# EasyEDA Pro project P3+KG.epro, board PCB1
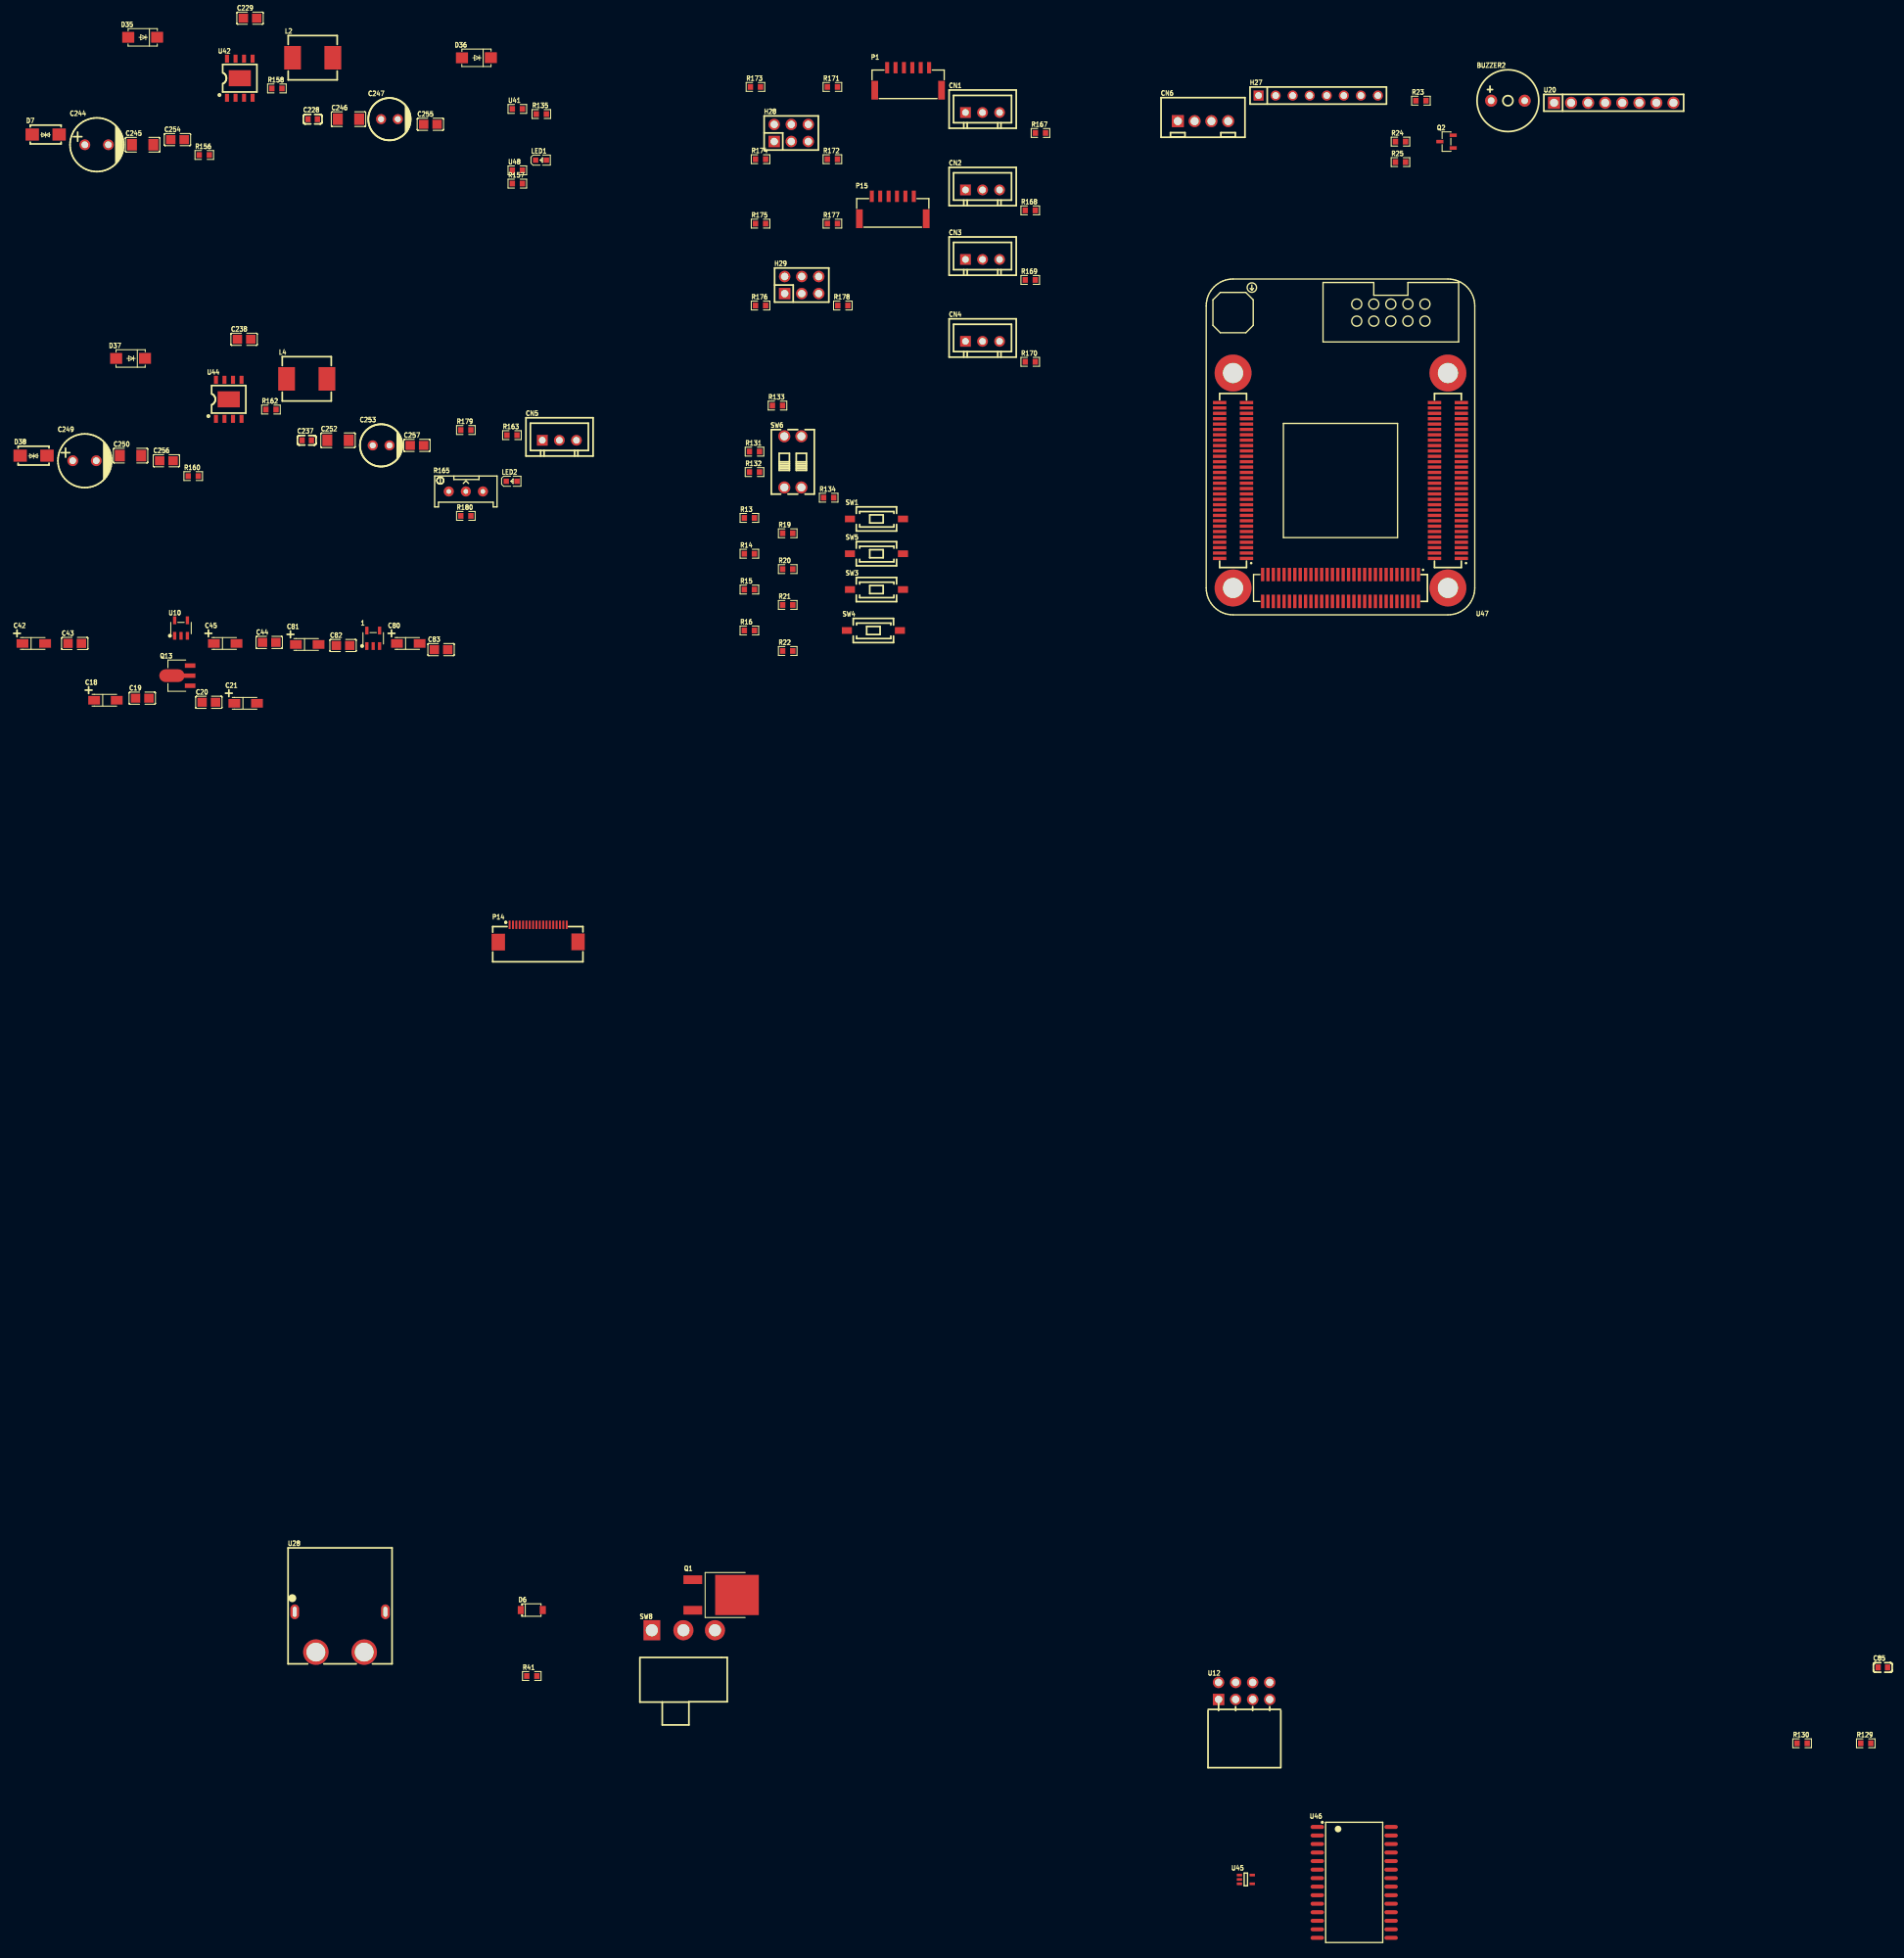
[diagram p11: board, top side]
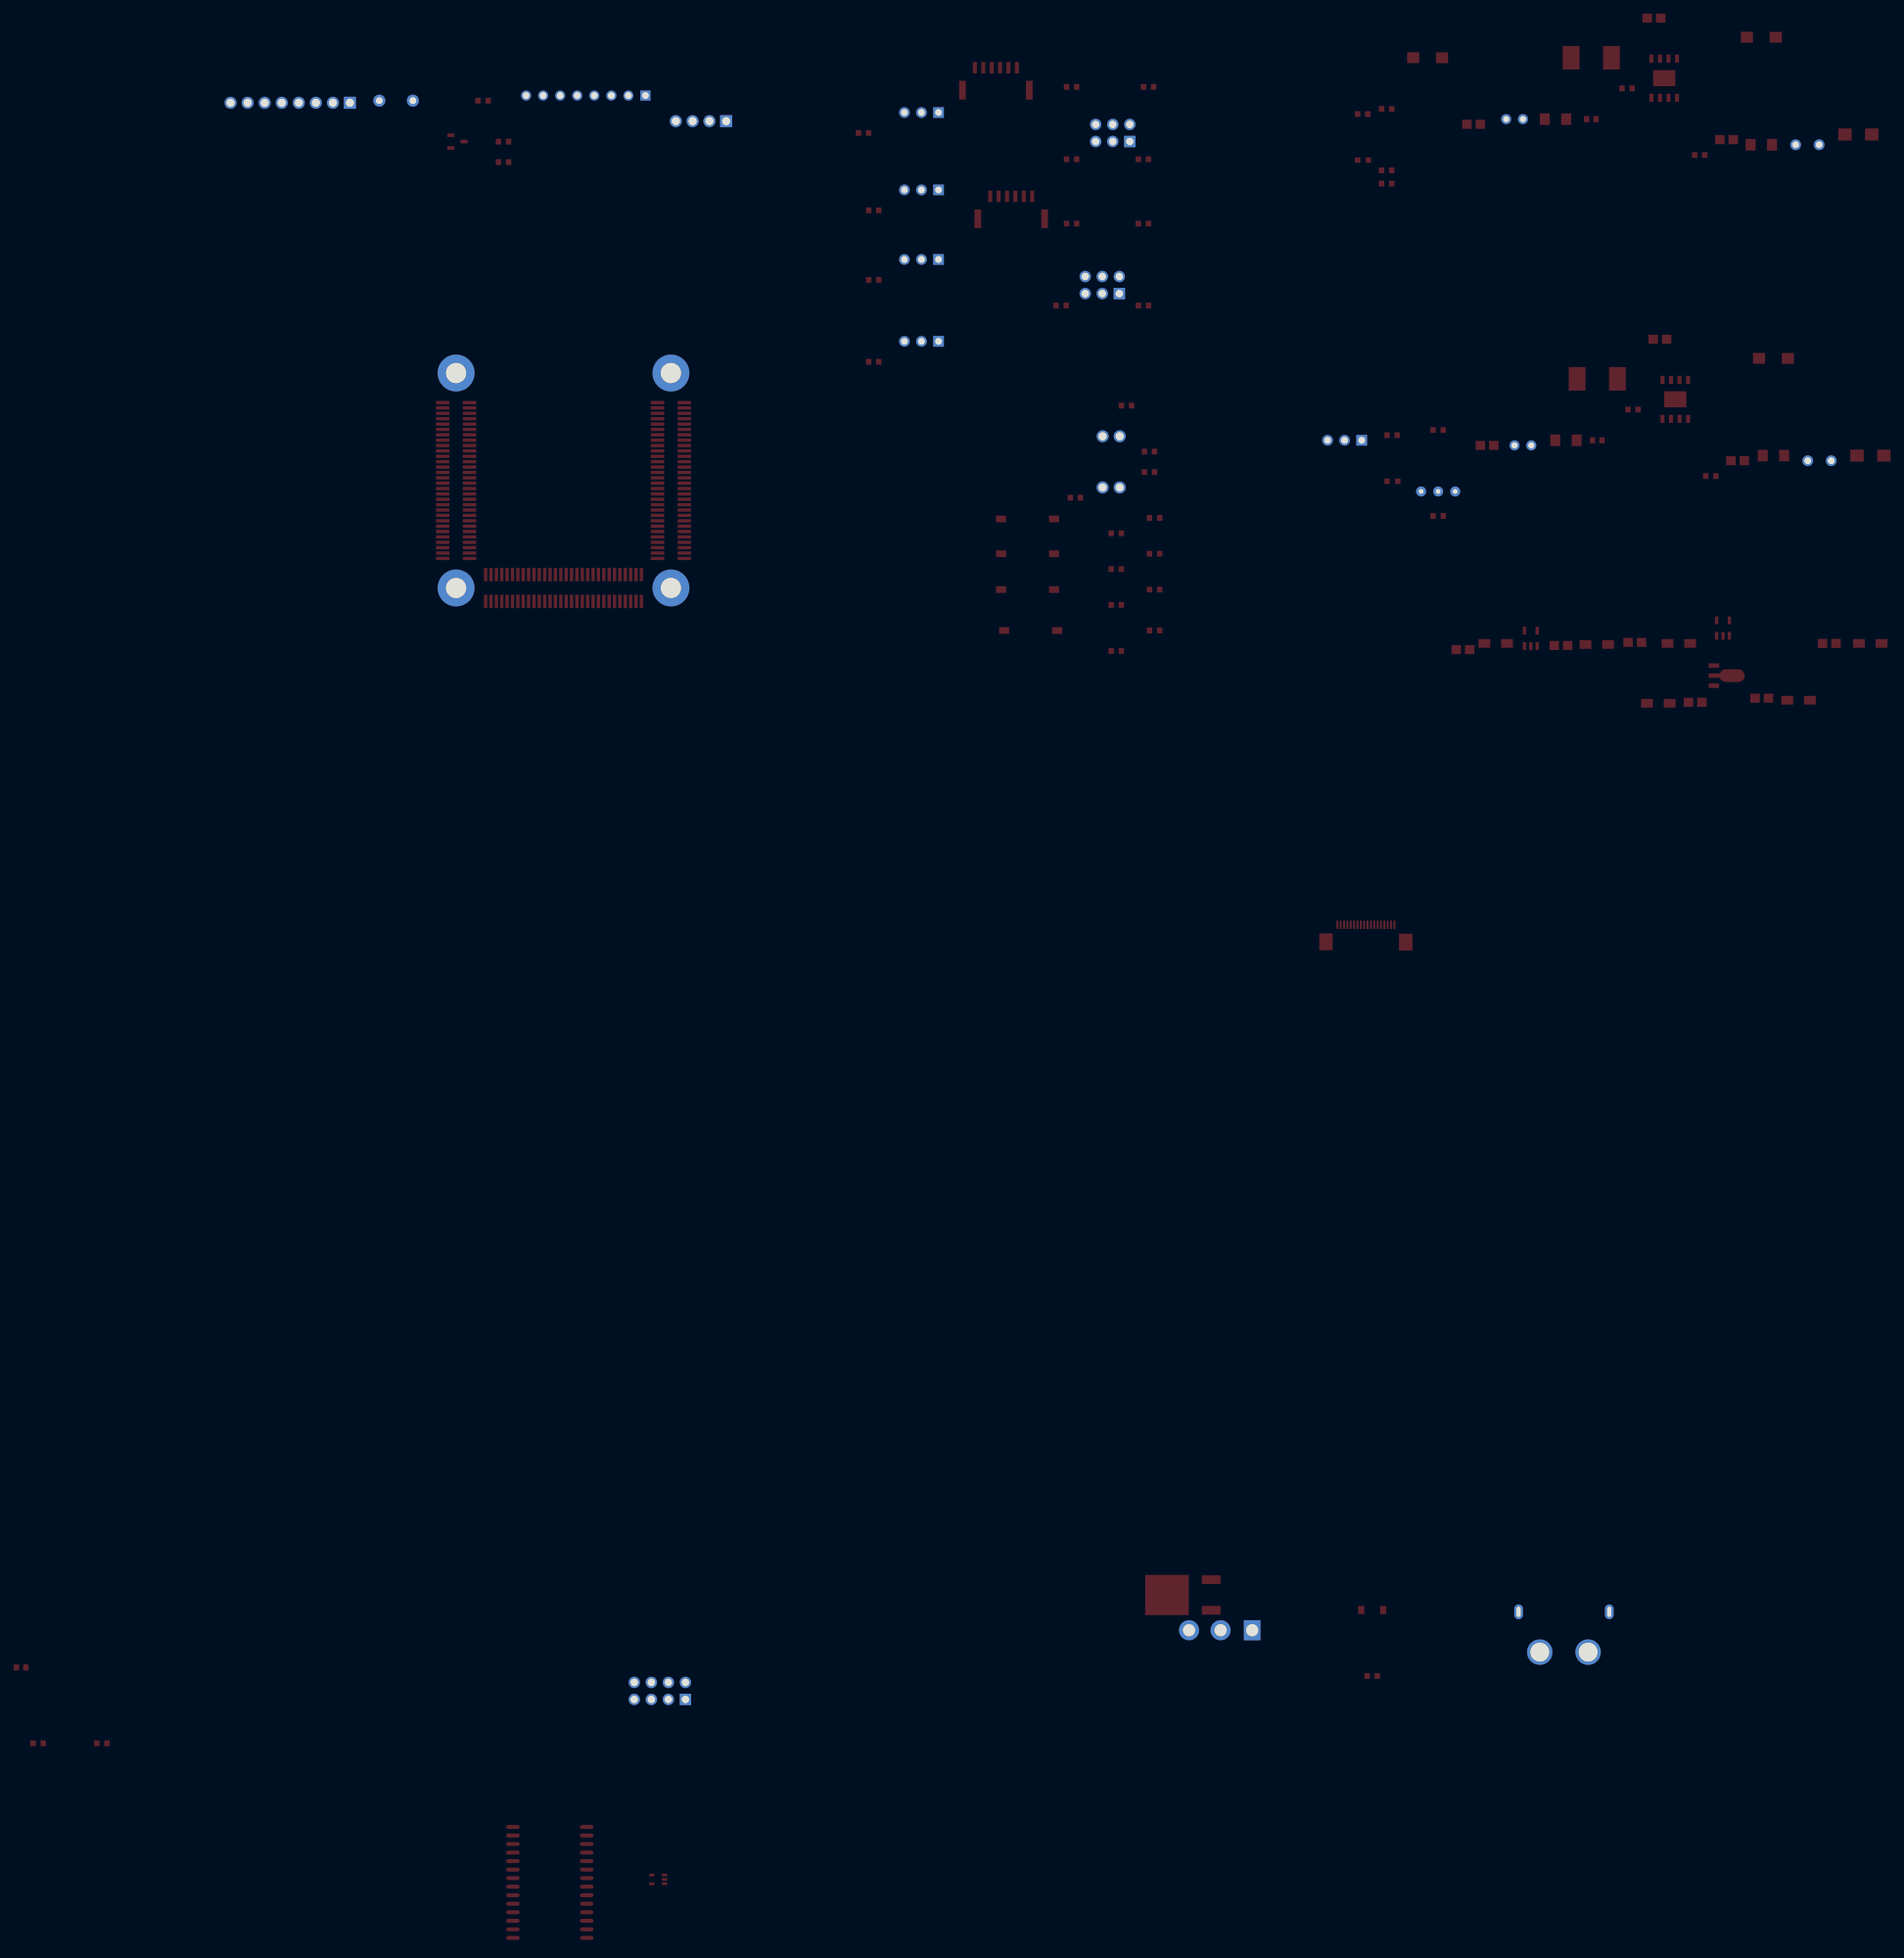
[diagram p12: board, bottom side, seen from below]

No outline. copper layers: Top Layer, Bottom Layer. Coordinates in mm from the lowest, leftmost part position.
Stack: Top Layer 0.035mm / Dielectric1 1.51mm FR4 er 4.5 / Bottom Layer 0.035mm

## Design rules (mm)
template: JLCPCB Capability(Two Layers Board)
spacing copperThickness1oz (default): track to track 0.102, other pairs 0.152 to 0.3
spacing copperThickness2oz: track to track 0.203, other pairs 0.152 to 0.3
track width copperThickness1oz (default): min 0.127, default 0.254, max 2.54
track width copperThickness2oz: min 0.203, default 0.254, max 2.54
differential pair differentialPair (default): width min 0.127, default 0.254, max 2.54; gap min 0.152, default 0.152
via viaSize (default): diameter min 0.5, default 0.61, max 10; hole min 0.3, default 0.305, max 6.3

## Placement (name value [footprint] x y rotation side)
1  RT9013-33GB  [SOT-23-5_L3.0-W1.7-P0.95-LS2.8-BL]  50.59 185.23 0 top
BUZZER2  3kHz  [BUZ-TH_BD9.0-P5.00-D0.6-FD]  219.6 265.28 0 top
C18  10uF  [CAP-SMD_L3.2-W1.6-RD-C7171]  10.7 176.01 0 top
C19  100nF  [C0805]  16.19 176.32 0 top
C20  100nF  [C0805]  26.1 175.71 0 top
C21  10uF  [CAP-SMD_L3.2-W1.6-RD-C7171]  31.59 175.55 0 top
C42  10uF  [CAP-SMD_L3.2-W1.6-RD-C7171]  0.03 184.47 0 top
C43  100nF  [C0805]  6.13 184.47 0 top
C44  100nF  [C0805]  35.09 184.62 0 top
C45  10uF  [CAP-SMD_L3.2-W1.6-RD-C7171]  28.54 184.47 0 top
C80  10uF  [CAP-SMD_L3.2-W1.6-RD-C7171]  55.82 184.47 0 top
C81  10uF  [CAP-SMD_L3.2-W1.6-RD-C7171]  40.76 184.31 0 top
C82  100nF  [C0805]  46.1 184.16 0 top
C83  100nF  [C0805]  60.69 183.55 0 top
C85  100nF  [C0603]  275.45 32 0 top
C228  4.7nF  [C0603]  41.58 262.52 0 top
C229  100nF  [C0805]  32.24 277.56 0 top
C237  4.7nF  [C0603]  40.69 214.71 0 top
C238  100nF  [C0805]  31.36 229.75 0 top
C244  100uF  [CAP-TH_BD8.0-P3.50-D0.5-FD]  9.39 258.71 0 top
C245  4.7uF  [C1206]  16.25 258.71 0 top
C246  47uF  [C1206]  46.91 262.52 0 top
C247  220uF  [CAP-TH_BD6.3-P2.50-D0.5-FD]  53.01 262.52 0 top
C249  100uF  [CAP-TH_BD8.0-P3.50-D0.5-FD]  7.59 211.67 0 top
C250  4.7uF  [C1206]  14.45 212.43 0 top
C252  47uF  [C1206]  45.35 214.71 0 top
C253  220uF  [CAP-TH_BD6.3-P2.50-D0.5-FD]  51.76 213.95 0 top
C254  100nF  [C0805]  21.43 259.48 0 top
C255  100nF  [C0805]  59.1 261.76 0 top
C256  100nF  [C0805]  19.78 211.67 0 top
C257  100nF  [C0805]  57.1 213.95 0 top
CN1  ZX-XH2.54-3PZZ  [CONN-TH_3P-P2.54_2501S-3P]  141.35 263.52 0 top
CN2  ZX-XH2.54-3PZZ  [CONN-TH_3P-P2.54_2501S-3P]  141.35 251.99 0 top
CN3  ZX-XH2.54-3PZZ  [CONN-TH_3P-P2.54_2501S-3P]  141.35 241.64 0 top
CN4  ZX-XH2.54-3PZZ  [CONN-TH_3P-P2.54_2501S-3P]  141.35 229.44 0 top
CN5  ZX-XH2.54-3PZZ  [CONN-TH_3P-P2.54_2501S-3P]  78.32 214.71 0 top
CN6  AXH-4A-11  [CONN-TH_KH-XH-4A-Z]  174.19 262.23 0 top
D6  BZT52C16  [SOD-123_L2.7-W1.6-LS3.7-RD]  74.21 40.55 0 top
D7  SMAJ18CA  [SMA_L4.4-W2.6-LS5.0-BI]  1.8 260.24 0 top
D35  SS54  [SMA_L4.3-W2.6-LS5.0-FD]  16.25 274.72 0 top
D36  SS54  [SMA_L4.3-W2.6-LS5.0-FD]  65.96 271.67 0 top
D37  SS54  [SMA_L4.3-W2.6-LS5.0-FD]  14.45 226.91 0 top
D38  SMAJ18CA  [SMA_L4.4-W2.6-LS5.0-BI]  0 212.43 0 top
H27  PZ254V-11-08P  [HDR-TH_8P-P2.54-V-M]  191.35 266.04 0 top
H28  PZ254V-12-6P  [HDR-TH_6P-P2.54-V-M-R2-C3-S2.54]  112.86 260.47 0 top
H29  PZ254V-12-6P  [HDR-TH_6P-P2.54-V-M-R2-C3-S2.54]  114.42 237.83 0 top
L2  4.7uH  [IND-SMD_L7.3-W6.6_YSPI07XX]  41.58 271.67 0 top
L4  4.7uH  [IND-SMD_L7.3-W6.6_YSPI07XX]  40.69 223.86 0 top
LED1  -  [LED_0603]  75.63 256.43 0 top
LED2  -  [LED_0603]  71.25 208.62 0 top
P1  GH1.25-6P  [ECD-GH1.25-6P-SV]  130.27 268.09 0 top
P14  FPC-05F-18PH20  [FPC-SMD_18P-P0.50_FPC-05F-18PH20]  75.16 141.29 0 top
P15  GH1.25-6P  [ECD-GH1.25-6P-SV]  127.98 248.94 0 top
Q1  HY19P03D  [TO-252-2_L6.6-W6.1-P4.57-LS9.9-TL-CW]  101.49 42.79 0 top
Q2  S8050  [SOT-23-3_L2.9-W1.3-P1.90-LS2.3-BR]  210.46 259.18 0 top
Q13  AMS1117-3.3V  [SOT-89-3_L4.5-W2.5-P1.50-LS4.2-BR]  21.96 179.67 0 top
R13  4.7kΩ  [R0603]  106.62 203.15 0 top
R14  4.7kΩ  [R0603]  106.62 197.82 0 top
R15  4.7kΩ  [R0603]  106.62 192.49 0 top
R16  4.7kΩ  [R0603]  106.62 186.39 0 top
R19  100Ω  [R0603]  112.33 200.87 0 top
R20  100Ω  [R0603]  112.33 195.53 0 top
R21  100Ω  [R0603]  112.33 190.2 0 top
R22  100Ω  [R0603]  112.33 183.34 0 top
R23  10Ω  [R0603]  206.65 265.28 0 top
R24  4.7kΩ  [R0603]  203.6 259.18 0 top
R25  10kΩ  [R0603]  203.6 256.13 0 top
R41  10kΩ  [R0603]  74.21 30.73 0 top
R129  1K  [R0603]  272.91 20.71 0 top
R130  10K  [R0603]  263.42 20.71 0 top
R131  4.7kΩ  [R0603]  107.38 213.02 0 top
R132  4.7kΩ  [R0603]  107.38 209.98 0 top
R133  100Ω  [R0603]  110.81 219.88 0 top
R134  100Ω  [R0603]  118.43 206.17 0 top
R135  2.7K  [R0603]  75.63 263.29 0 top
R156  200k  [R0603]  25.43 257.19 0 top
R157  10kΩ  [R0603]  72.06 252.93 0 top
R158  20kΩ  [R0603]  36.24 267.1 0 top
R160  200k  [R0603]  23.78 209.38 0 top
R162  20kΩ  [R0603]  35.36 219.29 0 top
R163  10K  [R0603]  71.25 215.48 0 top
R165  50K  [RESPOT3296W]  64.39 207.09 0 top
R167  100Ω  [R0603]  149.98 260.47 0 top
R168  100Ω  [R0603]  148.46 248.94 0 top
R169  100Ω  [R0603]  148.46 238.59 0 top
R170  100Ω  [R0603]  148.46 226.4 0 top
R171  100Ω  [R0603]  118.99 267.33 0 top
R172  100Ω  [R0603]  118.99 256.56 0 top
R173  100Ω  [R0603]  107.53 267.33 0 top
R174  100Ω  [R0603]  108.29 256.56 0 top
R175  100Ω  [R0603]  108.29 246.97 0 top
R176  100Ω  [R0603]  108.29 234.78 0 top
R177  100Ω  [R0603]  118.99 246.97 0 top
R178  100Ω  [R0603]  120.54 234.78 0 top
R179  27K  [R0603]  64.39 216.24 0 top
R180  8.2K  [R0603]  64.39 203.46 0 top
SW1  K2-1107ST-A1SW-06  [SW-SMD_L6.0-W3.6-LS8.0]  125.55 203 0 top
SW3  K2-1107ST-A1SW-06  [SW-SMD_L6.0-W3.6-LS8.0]  125.55 192.49 0 top
SW4  K2-1107ST-A1SW-06  [SW-SMD_L6.0-W3.6-LS8.0]  125.09 186.39 0 top
SW5  K2-1107ST-A1SW-06  [SW-SMD_L6.0-W3.6-LS8.0]  125.55 197.82 0 top
SW6  DSWB02LHGET  [SW-TH_DSWB02LHGET]  113.09 211.5 0 top
SW8  SS-12D06L5  [SW-TH_3P-P4.70_L11.1-W12.7]  96.79 37.55 0 top
U10  RT9013-33GB  [SOT-23-5_L3.0-W1.7-P0.95-LS2.8-BL]  21.96 186.75 0 top
U12  PM254-2-04-W-8.5  [HDR-TH_8P-P2.54-H-F-R2-C4-W8.5]  180.31 28.51 0 top
U20  -  [HDR-TH_8P-P2.54-V-F-1]  233.7 263.29 0 top
U28  XT60PW-F  [TH_2P-XT60PW-F]  45.65 37.29 0 top
U41  51K  [R0603]  72.06 264.05 0 top
U42  SCT2450STER  [ESOP-8_L4.9-W3.9-P1.27-LS6.0-BL-EP]  30.72 268.62 0 top
U44  SCT2450STER  [ESOP-8_L4.9-W3.9-P1.27-LS6.0-BL-EP]  29.07 220.81 0 top
U45  SN74LVC1G00DCKR  [SOT-353]  180.57 0.44 0 top
U46  AL422B  [SOP-28]  196.71 0 0 top
U47  SR6P3C4_CoreBoard  [SR6P3C4_CoreBoard_Lite]  194.67 208.72 180 top
U48  1.5K  [R0603]  72.06 254.9 0 top

## Footprints (pads in the part's own frame, mm; a bottom-side part is the same pattern mirrored in y, then rotated)
BUZ-TH_BD9.0-P5.00-D0.6-FD
  round 1.8 hole 1: 1(-2.5,0) 2(2.5,0)
C0603
  rect 0.8x0.9 smd: 1(-0.7,0) 2(0.7,0)
C0805
  rect 1.41x1.35 smd: 1(-1,0) 2(1,0)
C1206
  rect 1.485x1.728 smd: 1(-1.593,0) 2(1.593,0)
CAP-SMD_L3.2-W1.6-RD-C7171
  rect 1.758x1.296 smd: 1(-1.687,0) 2(1.687,0)
CAP-TH_BD6.3-P2.50-D0.5-FD
  round 1.5 hole 0.9: 1(-1.25,0) 2(1.25,0)
CAP-TH_BD8.0-P3.50-D0.5-FD
  round 1.6 hole 1: 1(-1.75,0) 2(1.75,0)
CONN-TH_3P-P2.54_2501S-3P
  rect 1.6x1.6 hole 1: 1(-2.54,0)
  round 1.6 hole 1: 2(0,0) 3(2.54,0)
CONN-TH_KH-XH-4A-Z
  rect 1.8x1.8 hole 1.2: 1(-3.75,0)
  round 1.8 hole 1.2: 2(-1.25,0) 3(1.25,0) 4(3.75,0)
ECD-GH1.25-6P-SV
  rect 1x2.8 smd: 0(-4.975,-1.25) 0(4.975,-1.25)
  rect 0.6x1.7 smd: 1(-3.125,2.1) 2(-1.875,2.1) 3(-0.625,2.1) 4(0.625,2.1) 5(1.875,2.1) 6(3.125,2.1)
ESOP-8_L4.9-W3.9-P1.27-LS6.0-BL-EP
  rect 0.6x1.2 smd: 1(-1.905,-2.909) 2(-0.635,-2.909) 3(0.635,-2.909) 4(1.905,-2.909) 5(1.905,2.909) 6(0.635,2.909) 7(-0.635,2.909) 8(-1.905,2.909)
  rect 3.3x2.4 smd: 9(0,0)
FPC-SMD_18P-P0.50_FPC-05F-18PH20
  rect 0.3x1.25 smd: 1(-4.25,1.288) 2(-3.75,1.288) 3(-3.25,1.288) 4(-2.75,1.288) 5(-2.25,1.288) 6(-1.75,1.288) 7(-1.25,1.288) 8(-0.75,1.288) 9(-0.25,1.288) 10(0.25,1.288) 11(0.75,1.288) 12(1.25,1.288) 13(1.75,1.288) 14(2.25,1.288) 15(2.75,1.288) 16(3.25,1.288) 17(3.75,1.288) 18(4.25,1.288)
  rect 2x2.5 smd: 19(-5.94,-1.288) 20(5.94,-1.252)
HDR-TH_6P-P2.54-V-M-R2-C3-S2.54
  rect 1.7x1.7 hole 1.1: 1(-2.54,-1.27)
  round 1.7 hole 1.1: 2(-2.54,1.27) 3(0,-1.27) 4(0,1.27) 5(2.54,-1.27) 6(2.54,1.27)
HDR-TH_8P-P2.54-H-F-R2-C4-W8.5
  rect 1.7x1.7 hole 1.1: 1(-3.81,-1.27)
  round 1.7 hole 1.1: 2(-3.81,1.27) 3(-1.27,-1.27) 4(-1.27,1.27) 5(1.27,-1.27) 6(1.27,1.27) 7(3.81,-1.27) 8(3.81,1.27)
HDR-TH_8P-P2.54-V-F-1
  rect 1.8x1.8 hole 1.2: 1(-7.22,1.67)
  round 1.8 hole 1.2: 2(-4.68,1.67) 3(-2.14,1.67) 4(0.4,1.67) 5(2.94,1.67) 6(5.48,1.67) 7(8.02,1.67) 8(10.56,1.67)
HDR-TH_8P-P2.54-V-M
  rect 1.5x1.5 hole 1: 1(-8.89,0)
  round 1.5 hole 1: 2(-6.35,0) 3(-3.81,0) 4(-1.27,0) 5(1.27,0) 6(3.81,0) 7(6.35,0) 8(8.89,0)
IND-SMD_L7.3-W6.6_YSPI07XX
  rect 2.5x3.5 smd: 1(-3,0) 2(3,0)
LED_0603
  rect 0.8x0.8 smd: 1(-0.851,-0.01) 2(0.75,-0.005)
R0603
  rect 0.806x0.864 smd: 1(-0.753,0) 2(0.753,0)
RESPOT3296W
  round 1.5 hole 0.7: 1(-2.54,0) 2(2.54,0) ADJ(0,0)
SMA_L4.3-W2.6-LS5.0-FD
  rect 1.8x1.62 smd: 1(-2.15,-0.009) 2(2.15,0.009)
SMA_L4.4-W2.6-LS5.0-BI
  rect 2x1.8 smd: 1(-2,0) 2(2,0)
SOD-123_L2.7-W1.6-LS3.7-RD
  rect 0.91x1.22 smd: 1(-1.635,0) 2(1.635,0)
SOP-28
  oval 2x0.6 smd: 1(-5.5,8.255) 2(-5.5,6.985) 3(-5.5,5.715) 4(-5.5,4.445) 5(-5.5,3.175) 6(-5.5,1.905) 7(-5.5,0.635) 8(-5.5,-0.635) 9(-5.5,-1.905) 10(-5.5,-3.175) 11(-5.5,-4.445) 12(-5.5,-5.715) 13(-5.5,-6.985) 14(-5.5,-8.255) 15(5.5,-8.255) 16(5.5,-6.985) 17(5.5,-5.715) 18(5.5,-4.445) 19(5.5,-3.175) 20(5.5,-1.905) 21(5.5,-0.635) 22(5.5,0.635) 23(5.5,1.905) 24(5.5,3.175) 25(5.5,4.445) 26(5.5,5.715) 27(5.5,6.985) 28(5.5,8.255)
SOT-23-3_L2.9-W1.3-P1.90-LS2.3-BR
  rect 1.07x0.532 smd: 1(0.99,-0.95) 2(0.99,0.95) 3(-0.99,0)
SOT-23-5_L3.0-W1.7-P0.95-LS2.8-BL
  rect 0.49x1.157 smd: 1(-0.95,-1.153) 2(0,-1.153) 3(0.95,-1.153)
  rect 0.49x1.175 smd: 4(0.95,1.153) 5(-0.95,1.153)
SOT-89-3_L4.5-W2.5-P1.50-LS4.2-BR
  rect 1.575x0.672 smd: 1(1.356,-1.5) 3(1.356,1.5)
  custom 5.377x1.9 smd: 2(-1.356,0)
SOT-353
  rect 0.8x0.4 smd: 1(-0.95,0.65) 2(-0.95,0) 3(-0.95,-0.65) 4(0.95,-0.65) 5(0.95,0.65)
SR6P3C4_CoreBoard_Lite
  round 5.5 hole 3: 0(-16,16) 0(-16,-16) 0(16,16) 0(16,-16)
  round 0 hole 0.65: 1(-17.25,12.5) 1(-17.25,-12.5) 1(-12.5,14.75) 1(12.5,14.75) 1(14.75,12.5) 1(14.75,-12.5)
  rect 0.5x2 smd: A1(-11.6,14) A2(-11.6,18) A3(-10.8,14) A4(-10.8,18) A5(-10,14) A6(-10,18) A7(-9.2,14) A8(-9.2,18) A9(-8.4,14) A10(-8.4,18) A11(-7.6,14) A12(-7.6,18) A13(-6.8,14) A14(-6.8,18) A15(-6,14) A16(-6,18) A17(-5.2,14) A18(-5.2,18) A19(-4.4,14) A20(-4.4,18) A21(-3.6,14) A22(-3.6,18) A23(-2.8,14) A24(-2.8,18) A25(-2,14) A26(-2,18) A27(-1.2,14) A28(-1.2,18) A29(-0.4,14) A30(-0.4,18) A31(0.4,14) A32(0.4,18) A33(1.2,14) A34(1.2,18) A35(2,14) A36(2,18) A37(2.8,14) A38(2.8,18) A39(3.6,14) A40(3.6,18) A41(4.4,14) A42(4.4,18) A43(5.2,14) A44(5.2,18) A45(6,14) A46(6,18) A47(6.8,14) A48(6.8,18) A49(7.6,14) A50(7.6,18) A51(8.4,14) A52(8.4,18) A53(9.2,14) A54(9.2,18) A55(10,14) A56(10,18) A57(10.8,14) A58(10.8,18) A59(11.6,14) A60(11.6,18)
  rect 2x0.5 smd: B1(-18,11.6) B2(-14,11.6) B3(-18,10.8) B4(-14,10.8) B5(-18,10) B6(-14,10) B7(-18,9.2) B8(-14,9.2) B9(-18,8.4) B10(-14,8.4) B11(-18,7.6) B12(-14,7.6) B13(-18,6.8) B14(-14,6.8) B15(-18,6) B16(-14,6) B17(-18,5.2) B18(-14,5.2) B19(-18,4.4) B20(-14,4.4) B21(-18,3.6) B22(-14,3.6) B23(-18,2.8) B24(-14,2.8) B25(-18,2) B26(-14,2) B27(-18,1.2) B28(-14,1.2) B29(-18,0.4) B30(-14,0.4) B31(-18,-0.4) B32(-14,-0.4) B33(-18,-1.2) B34(-14,-1.2) B35(-18,-2) B36(-14,-2) B37(-18,-2.8) B38(-14,-2.8) B39(-18,-3.6) B40(-14,-3.6) B41(-18,-4.4) B42(-14,-4.4) B43(-18,-5.2) B44(-14,-5.2) B45(-18,-6) B46(-14,-6) B47(-18,-6.8) B48(-14,-6.8) B49(-18,-7.6) B50(-14,-7.6) B51(-18,-8.4) B52(-14,-8.4) B53(-18,-9.2) B54(-14,-9.2) B55(-18,-10) B56(-14,-10) B57(-18,-10.8) B58(-14,-10.8) B59(-18,-11.6) B60(-14,-11.6) C1(14,11.6) C2(18,11.6) C3(14,10.8) C4(18,10.8) C5(14,10) C6(18,10) C7(14,9.2) C8(18,9.2) C9(14,8.4) C10(18,8.4) C11(14,7.6) C12(18,7.6) C13(14,6.8) C14(18,6.8) C15(14,6) C16(18,6) C17(14,5.2) C18(18,5.2) C19(14,4.4) C20(18,4.4) C21(14,3.6) C22(18,3.6) C23(14,2.8) C24(18,2.8) C25(14,2) C26(18,2) C27(14,1.2) C28(18,1.2) C29(14,0.4) C30(18,0.4) C31(14,-0.4) C32(18,-0.4) C33(14,-1.2) C34(18,-1.2) C35(14,-2) C36(18,-2) C37(14,-2.8) C38(18,-2.8) C39(14,-3.6) C40(18,-3.6) C41(14,-4.4) C42(18,-4.4) C43(14,-5.2) C44(18,-5.2) C45(14,-6) C46(18,-6) C47(14,-6.8) C48(18,-6.8) C49(14,-7.6) C50(18,-7.6) C51(14,-8.4) C52(18,-8.4) C53(14,-9.2) C54(18,-9.2) C55(14,-10) C56(18,-10) C57(14,-10.8) C58(18,-10.8) C59(14,-11.6) C60(18,-11.6)
SW-SMD_L6.0-W3.6-LS8.0
  rect 1.5x1 smd: 1(-3.95,0) 2(3.95,0)
SW-TH_3P-P4.70_L11.1-W12.7
  rect 2.5x3 hole 1.8: 1(-4.7,0)
  round 3 hole 1.8: 2(0,0) 3(4.7,0)
SW-TH_DSWB02LHGET
  round 1.8 hole 1.2: 1(-1.27,3.81) 2(1.27,3.81) 3(-1.27,-3.81) 4(1.27,-3.81)
TH_2P-XT60PW-F
  oval 1.3x2.2 hole 0.6x1.5: 1(-6.75,3) 2(6.75,3)
  round 3.8 hole 2.8: 3(-3.6,-3) 4(3.6,-3)
TO-252-2_L6.6-W6.1-P4.57-LS9.9-TL-CW
  rect 2.8x1.3 smd: 1(-3.292,2.273) 3(-3.292,-2.273)
  rect 6.5x6 smd: 2(3.292,0)

## Nets
As in the schematic.

Pads without a net: 1 4; CN1 2; CN2 2; CN3 2; CN4 2; H28 3 4; H29 3 4; P1 0 5 6; P14 5 19 20; P15 0 5 6; U10 4; U12 2; U28 1 2; U45 1 2 3 4 5; U46 1 2 3 4 5 6 7 8 9 10 11 12 13 14 15 16 17 18 19 20 21 22 23 24 25 26 27 28; U47 0 1 A1 A2 A3 A4 A5 A6 A7 A8 A9 A10 A11 A12 A13 A14 A15 A16 A17 A18 A19 A20 A21 A22 A23 A24 A25 A26 A27 A28 A29 A30 A31 A32 A33 A34 A35 A36 A37 A38 A39 A40 A41 A42 A43 A44 A45 A46 A47 A48 A49 A50 A51 A52 A53 A54 A55 A56 A57 A58 A59 A60 B1 B2 B3 B4 B5 B6 B7 B8 B9 B10 B11 B12 B13 B14 B15 B16 B17 B18 B19 B20 B21 B22 B23 B24 B25 B26 B27 B28 B29 B30 B31 B32 B33 B34 B35 B36 B37 B38 B39 B40 B41 B42 B43 B44 B45 B46 B47 B48 B49 B50 B51 B52 B53 B54 B55 B56 B57 B58 B59 B60 C1 C2 C3 C4 C5 C6 C7 C8 C9 C10 C11 C12 C13 C14 C15 C16 C17 C18 C19 C20 C21 C22 C23 C24 C25 C26 C27 C28 C29 C30 C31 C32 C33 C34 C35 C36 C37 C38 C39 C40 C41 C42 C43 C44 C45 C46 C47 C48 C49 C50 C51 C52 C53 C54 C55 C56 C57 C58 C59 C60
